# Altium schematic sheet 3_SCH_Autolog.SchDoc: PROYECTO FINAL - AutoLog
size A4; Revision: V1R1; SheetNumber: 4; SheetTotal: 4
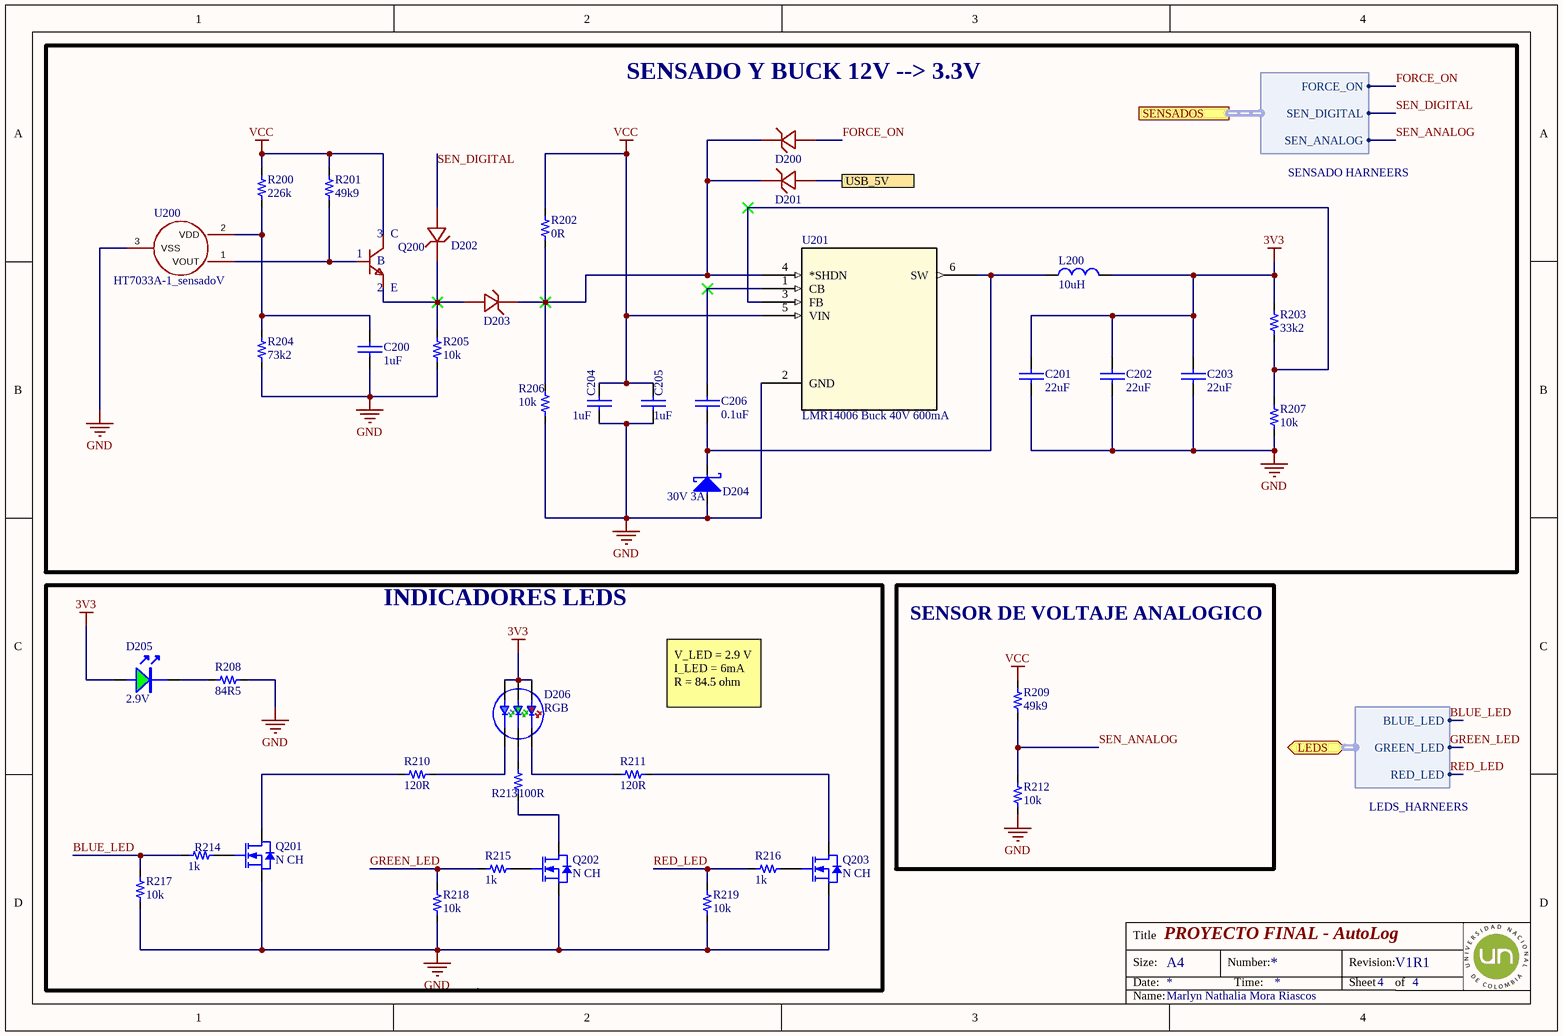
[diagram p0: 3_SCH_Autolog.SchDoc]

## Parts
C200  value 1uF  [0603_cap]  (hidden comment: 1uF 50V)
C201  value 22uF  [0603_cap]  (hidden comment: 22uF 10V)
C202  value 22uF  [0603_cap]  (hidden comment: 22uF 10V)
C203  value 22uF  [0603_cap]  (hidden comment: 22uF 10V)
C204  value 1uF  [0603_cap]  (hidden comment: 1uF 50V)
C205  value 1uF  [0603_cap]  (hidden comment: 1uF 50V)
C206  value 0.1uF  [0603_cap]  (hidden comment: 0.1uF 50V)
D200  1N4148WS  [SOD-323_1N4148]  (value not drawn)
D201  1N4148WS  [SOD-323_1N4148]  (value not drawn)
D202  1N4148WS  [SOD-323_1N4148]  (value not drawn)
D203  1N4148WS  [SOD-323_1N4148]  (value not drawn)
D204  30V 3A  [SMA]
D205  2.9V  [0805_LED]
D206  RGB  [RGB_NS_3.5X3.7]
L200  value 10uH  [Ind_5.8*5.2_NS]  (hidden comment: 10uH 1.42A)
Q200  SS8050  [SOT-23-3_TRANS NPN]  (value not drawn)
Q201  N CH  [SOT_23_3]
Q202  N CH  [SOT_23_3]
Q203  N CH  [SOT_23_3]
R200  value 226k  [0603_res]  (hidden comment: 226k 1/10W)
R201  value 49k9  [0603_res]  (hidden comment: 49k9 1/10W)
R202  value 0R  [0603_res]  (hidden comment: 0R 1/10W)
R203  value 33k2  [0603_res]  (hidden comment: 33k2 1/10W)
R204  value 73k2  [0603_res]  (hidden comment: 73k2 1/10W)
R205  value 10k  [0603_res]  (hidden comment: 10k 1/10W)
R206  value 10k  [0603_res]  (hidden comment: 10k 1/10W)
R207  value 10k  [0603_res]  (hidden comment: 10k 1/10W)
R208  value 84R5  [0603_res]  (hidden comment: 84R5 1/10W)
R209  value 49k9  [0603_res]  (hidden comment: 49k9 1/10W)
R210  value 120R  [0603_res]  (hidden comment: 120R 1/10W)
R211  value 120R  [0603_res]  (hidden comment: 120R 1/10W)
R212  value 10k  [0603_res]  (hidden comment: 10k 1/10W)
R213  value 100R  [0603_res]  (hidden comment: 100R 1/10W)
R214  value 1k  [0603_res]  (hidden comment: 1k 1/10W)
R215  value 1k  [0603_res]  (hidden comment: 1k 1/10W)
R216  value 1k  [0603_res]  (hidden comment: 1k 1/10W)
R217  value 10k  [0603_res]  (hidden comment: 10k 1/10W)
R218  value 10k  [0603_res]  (hidden comment: 10k 1/10W)
R219  value 10k  [0603_res]  (hidden comment: 10k 1/10W)
U200  HT7033A-1_sensadoV  [SOT-89-3_L4.5-W2.5-P1.50-LS4.2-BR]
U201  LMR14006 Buck 40V 600mA  [DDC6_TEX-M]

## Blocks framed on the sheet
SENSADO Y BUCK 12V --> 3.3V: C200-C206 D200-D204 L200 Q200 R200-R207 U200 U201
INDICADORES LEDS: D205 D206 Q201-Q203 R208 R210 R211 R213-R219
SENSOR DE VOLTAJE ANALOGICO: R209 R212

## Ports
LEDS (bidir, harness LEDS_HARNEERS, see Maiin[2C], 1_SCH_Autolog[2C]), SENSADOS (harness SENSADO HARNEERS, see Maiin[2C], 1_SCH_Autolog[2C]), USB_5V (see Maiin[3C], 2_SCH_Autolog[4B])

## Harnesses
LEDS_HARNEERS: RED_LED, GREEN_LED, BLUE_LED
SENSADO HARNEERS: FORCE_ON, SEN_DIGITAL, SEN_ANALOG

## Nets
3V3: C201.1 C202.1 C203.1 D205.1(A) D206.4 D206.5 D206.6 L200.2 R203.2
GND: C200.2 C201.2 C202.2 C203.2 C204.2 C205.2 D204.2 Q201.2(S) Q202.2(S) Q203.2(S) R204.1 R205.1 R206.1 R207.1 R208.2 R212.1 R217.2 R218.1 R219.1 U200.3(VSS) U201.2(GND)
VCC: C204.1 C205.1 Q200.3(C) R200.2 R201.1 R202.2 R209.2 U201.5(VIN)
BLUE_LED: R214.1 R217.1 ; port LEDS.BLUE_LED
FORCE_ON: D200.2 ; port SENSADOS.FORCE_ON
GREEN_LED: R215.1 R218.2 ; port LEDS.GREEN_LED
RED_LED: R216.1 R219.2 ; port LEDS.RED_LED
SEN_ANALOG: R209.1 R212.2 ; port SENSADOS.SEN_ANALOG
SEN_DIGITAL: D202.2 ; port SENSADOS.SEN_DIGITAL
USB_5V: D201.2 ; port USB_5V
NetC200_1: C200.1 R200.1 R204.2 U200.2(VDD)
NetC206_1: C206.1 U201.1(CB)
NetC206_2: C206.2 D204.1 L200.1 U201.6(SW)
NetD200_1: D200.1 D201.1 D203.1 R202.1 R206.2 U201.4(*SHDN)
NetD202_1: D202.1 D203.2 Q200.2(E) R205.2
NetD205_2: D205.2 R208.1
NetD206_1: D206.1 R210.1
NetD206_2: D206.2 R213.1
NetD206_3: D206.3 R211.1
NetQ200_1: Q200.1(B) R201.2 U200.1(VOUT)
NetQ201_1: Q201.1(G) R214.2
NetQ201_3: Q201.3(D) R210.2
NetQ202_1: Q202.1(G) R215.2
NetQ202_3: Q202.3(D) R213.2
NetQ203_1: Q203.1(G) R216.2
NetQ203_3: Q203.3(D) R211.2
NetR203_1: R203.1 R207.2 U201.3(FB)

## Notes on the sheet
- V_LED = 2.9 V
  I_LED = 6mA
  R = 84.5 ohm
- Title
- Size:
- Date:
- A4
- Number:
- Time:
- Revision:
- Sheet
- of
- Name:
- Marlyn Nathalia Mora Riascos

## Library data of the parts
C200 C204 C205 = Cap_1uF_0603_50V: 50V 1uF X5R ±10% 0603 Multilayer Ceramic Capacitors MLCC - SMD/SMT ROHS; Manufacturer: Samsung Electro-Mechanics; Manufacturer Part Number: CL10A105KB8NNNC; Supplier 1: LCSC; Supplier Part Number 1: C15849; ComponentLink1Description: LCSC; ComponentLink1URL: https://www.lcsc.com/product-detail/Multilayer-Ceramic-Capacitors-MLCC-SMD-SMT_Samsung-Electro-Mechanics-CL10A105KB8NNNC_C15849.html
  C200: ComponentLink2Description: Datashhet; ComponentLink2URL: https://www.lcsc.com/datasheet/C15849.pdf
C201-C203 = Cap_22uF_0603_10V: 10V 22uF X5R ±20% 0603 Multilayer Ceramic Capacitors MLCC - SMD/SMT ROHS; Manufacturer: HRE; Manufacturer Part Number: CGA0603X5R226M100JT; Supplier 1: LCSC; Supplier Part Number 1: C6119863; ComponentLink1Description: LCSC; ComponentLink1URL: https://lcsc.com/product-detail/Multilayer-Ceramic-Capacitors-MLCC-SMD-SMT_HRE-CGA0603X5R226M100JT_C6119863.html; ComponentLink2Description: Datasheet; ComponentLink2URL: https://www.lcsc.com/datasheet/C6119863.pdf
C206 = Cap_0.1uF_0603_50V: 50V 100nF Y5V -20%~+80% 0603 Multilayer Ceramic Capacitors MLCC - SMD/SMT ROHS; Manufacturer: Walsin Tech Corp; Manufacturer Part Number: 0603F104Z500CT; Supplier 1: LCSC; Supplier Part Number 1: C83060; ComponentLink1Description: LCSC; ComponentLink1URL: https://www.lcsc.com/product-detail/Multilayer-Ceramic-Capacitors-MLCC-SMD-SMT_Walsin-Tech-Corp-0603F104Z500CT_C83060.html; ComponentLink2Description: Datasheet; ComponentLink2URL: https://www.lcsc.com/datasheet/C83060.pdf
D200-D203 = 1N4148WS_DIODE: DIODE GP 100V 150mA SOD-323; Manufacturer: JSCJ; Manufacturer Part Number: 1N4148WS; Supplier 1: LCSC; Supplier Part Number 1: C2128; ComponentLink1Description: JSCJ; ComponentLink1URL: https://www.lcsc.com/product-detail/Switching-Diode_JCET-1N4148WS_C2128.html; ComponentLink2Description: Datasheet; ComponentLink2URL: https://www.lcsc.com/datasheet/C2128.pdf
D204 = D_Schottky_40V_3A_SMA: 40V Independent 3A 550mV@3A SMA Schottky Diodes ROHS; Manufacturer: TDSEMIC; Manufacturer Part Number: SS34-TD; Supplier 1: LCSC; Supplier Part Number 1: C46550832; ComponentLink1Description: LCSC; ComponentLink1URL: https://lcsc.com/product-detail/Schottky-Diodes_TDSEMIC-SS34-TD_C46550832.html; ComponentLink2Description: Datasheet; ComponentLink2URL: https://www.lcsc.com/datasheet/C46550832.pdf; ComponentLink3Description: New link
D205 = LED_0805_Green: LED GREEN CLEAR 0805 SMD; Manufacturer: XINGLIGHT; Manufacturer Part Number: XL-2012UGC; Supplier 1: LCSC; Supplier Part Number 1: C965815; ComponentLink1Description: LCSC; ComponentLink1URL: https://www.lcsc.com/product-detail/Light-Emitting-Diodes-LED_XINGLIGHT-XL-2012UGC_C965815.html
D206 = LED_RGB_3535_SMD: -30℃~+85℃ RGB 110° 3535(mm) Light Emitting Diodes (LED) ROHS; Manufacturer: Foshan NationStar Optoelectronics; Manufacturer Part Number: RS-3535MWAM; Supplier 1: LCSC; Supplier Part Number 1: C842778; ComponentLink1Description: LCSC; ComponentLink1URL: https://www.lcsc.com/product-detail/Light-Emitting-Diodes-LED_Foshan-NationStar-Optoelectronics-RS-3535MWAM_C842778.html
L200 = Inductor_10uH_1.42A_5.8*5.2mm: 1.42A 10uH ±10% 87.9mΩ SMD,5.8x5.2mm Inductors (SMD) ROHS; Manufacturer: SHOU HAN; Manufacturer Part Number: CY54-10UH; Supplier 1: LCSC; Supplier Part Number 1: C2929431; ComponentLink1Description: LCSC; ComponentLink1URL: https://lcsc.com/product-detail/Inductors-SMD_SHOU-HAN-CY54-4-7UH_C2929429.html; ComponentLink2Description: Datasheet; ComponentLink2URL: https://www.lcsc.com/datasheet/C2929429.pdf
Q200 = TRANS_NPN_SS8050_SOT23: SS8050 Transistor BJT NPN 40V 1.5A; Manufacturer: JSCJ; Manufacturer Part Number: SS8050(RANGE:200-350); Supplier 1: LCSC; Supplier Part Number 1: C2150; ComponentLink1Description: LCSC; ComponentLink1URL: https://www.lcsc.com/product-detail/Bipolar-Transistors-BJT_JCET-SS8050_C2150.html; ComponentLink2Description: Datasheet; ComponentLink2URL: https://www.lcsc.com/datasheet/C2150.pdf
Q201-Q203 = Q_NFET_20V_3.2A_SOT23: MOSFET N-CH 20V SOT23; Manufacturer: Doeshare; Manufacturer Part Number: DN2302S; Supplier 1: LCSC; Supplier Part Number 1: C2931750; ComponentLink1Description: LCSC; ComponentLink1URL: https://www.lcsc.com/product-detail/MOSFETs_Doeshare-DN2302S_C2931750.html
R200 = Res_226k_0603_1/10W: 100mW Thick Film Resistors 75V ±100ppm/℃ ±1% 226kΩ 0603 Chip Resistor - Surface Mount ROHS; Manufacturer: YAGEO; Manufacturer Part Number: RC0603FR-07226KL; ComponentLink1URL: https://lcsc.com/product-detail/Chip-Resistor-Surface-Mount_YAGEO-RC0603FR-07226KL_C165744.html; Supplier 1: LCSC; Supplier Part Number 1: C165744; ComponentLink1Description: LCSC
R201 R209 = Res_49k9_0603_1/10W: 100mW Thick Film Resistor 75V ±100ppm/℃ ±1% 49.9kΩ 0603 Chip Resistor - Surface Mount ROHS; Manufacturer: YAGEO; Manufacturer Part Number: RC0603FR-0749K9L; ComponentLink1URL: https://lcsc.com/product-detail/Chip-Resistor-Surface-Mount_YAGEO-RC0603FR-0749K9L_C114624.html; Supplier 1: LCSC; Supplier Part Number 1: C114624; ComponentLink1Description: LCSC
R202 = Res_0R_0603_1/10W: RES SMD 0R OHM 5% 1/10W 0603; Manufacturer: FOJAN; Manufacturer Part Number: FRC0603P000 TS; ComponentLink1URL: https://www.lcsc.com/product-detail/Chip-Resistor-Surface-Mount_FOJAN-FRC0603P000-TS_C2907080.html; Supplier 1: LCSC; Supplier Part Number 1: C2907080; ComponentLink1Description: LCSC; ComponentLink2Description: Datasheet; ComponentLink2URL: https://www.lcsc.com/datasheet/C2907080.pdf
R203 = Res_33k2_0603_1/10W: 100mW Thick Film Resistor 75V ±100ppm/℃ ±1% 33.2kΩ 0603 Chip Resistor - Surface Mount ROHS; Manufacturer: YAGEO; Manufacturer Part Number: RC0603FR-0733K2L; ComponentLink1URL: https://lcsc.com/product-detail/Chip-Resistor-Surface-Mount_YAGEO-RC0603FR-0733K2L_C185338.html; Supplier 1: LCSC; Supplier Part Number 1: C185338; ComponentLink1Description: LCSC; ComponentLink2Description: Datasheet; ComponentLink2URL: https://www.lcsc.com/datasheet/C185338.pdf
R204 = Res_73k2_0603_1/10W: 100mW Thick Film Resistor 75V ±100ppm/℃ ±1% 73.2kΩ 0603 Chip Resistor - Surface Mount ROHS; Manufacturer: YAGEO; Manufacturer Part Number: RC0603FR-0773K2L; ComponentLink1URL: https://lcsc.com/product-detail/Chip-Resistor-Surface-Mount_YAGEO-RC0603FR-0773K2L_C163420.html; Supplier 1: LCSC; Supplier Part Number 1: C163420; ComponentLink1Description: LCSC
R205-R207 R212 R217-R219 = Res_10k_0603_1/10W: RES SMD 10k OHM 5% 1/10W 0603; Manufacturer: FOJAN; Manufacturer Part Number: FRC0603J103TS; ComponentLink1URL: https://www.lcsc.com/product-detail/Chip-Resistor-Surface-Mount_FOJAN-FRC0603J103TS_C2930027.html; Supplier 1: LCSC; Supplier Part Number 1: C2930027; ComponentLink1Description: LCSC; ComponentLink2Description: Datasheet; ComponentLink2URL: https://www.lcsc.com/datasheet/C2930027.pdf
R208 = Res_84R5_0603_1/10W: 100mW Thick Film Resistor 50V ±100ppm/℃ ±1% 84.5Ω 0603 Chip Resistor - Surface Mount ROHS; Manufacturer: LIZ Elec; Manufacturer Part Number: CR0603FA84R5G; ComponentLink1URL: https://lcsc.com/product-detail/Chip-Resistor-Surface-Mount_LIZ-Elec-CR0603FA84R5G_C101216.html; Supplier 1: LCSC; Supplier Part Number 1: C101216; ComponentLink1Description: LCSC
R210 R211 = Res_120R_0603_1/10W: 100mW Thick Film Resistor 75V ±100ppm/℃ ±1% 120Ω 0603 Chip Resistor - Surface Mount ROHS; Manufacturer: FOJAN; Manufacturer Part Number: FRC0603F1200TS; ComponentLink1URL: https://lcsc.com/product-detail/Chip-Resistor-Surface-Mount_FOJAN-FRC0603F1200TS_C2906988.html; Supplier 1: LCSC; Supplier Part Number 1: C2906988; ComponentLink1Description: LCSC; ComponentLink2Description: Datasheet; ComponentLink2URL: https://www.lcsc.com/datasheet/C2906988.pdf
R213 = Res_100R_0603_1/10W: RES SMD 100R OHM 5% 1/10W 0603; Manufacturer: FOJAN; Manufacturer Part Number: FRC0603J101 TS; ComponentLink1URL: https://www.lcsc.com/product-detail/Chip-Resistor-Surface-Mount_FOJAN-FRC0603J101-TS_C2907089.html; Supplier 1: LCSC; Supplier Part Number 1: C2907089; ComponentLink1Description: LCSC
R214-R216 = Res_1k_0603_1/10W: RES SMD 1k OHM 5% 1/10W 0603; Manufacturer: FOJAN; Manufacturer Part Number: FRC0603J102 TS; ComponentLink1URL: https://www.lcsc.com/product-detail/Chip-Resistor-Surface-Mount_FOJAN-FRC0603J102-TS_C2907113.html; Supplier 1: LCSC; Supplier Part Number 1: C2907113; ComponentLink1Description: LCSC; ComponentLink2Description: Datashhet; ComponentLink2URL: https://www.lcsc.com/datasheet/C2907152.pdf
U200 = HOLTEK HT7033A-1_sensadoV: Detector de tensión con umbral de 3.3V; Manufacturer: HOLTEK; Suplier  Part Number: C73715; Manufacturer product number: HT7033A-1; ComponentLink1Description: DataSheep; ComponentLink1URL: https://datasheet4u.com/download/529551/HT7033A-1.html; Supplier 1: LCSC; ComponentLink2Description: LCSC; ComponentLink2URL: https://www.lcsc.com/product-detail/C73715.html?s_z=n_q_p_HT7033A-1%2520SOT-23&spm=wm.ssy.bg.0.stp&lcsc_vid=RVlWUQFUEwdfUgVfRQdXU1JeFFlaBFcDFVVaX1BTQFUxVlNfRVhaXldRT1NYUTsOAxUeFF5JWBYZEEoKFBINSQcJGk4eFQsCAgIaSgADAwAHC0swGA0aBgMDWiULEwEFAw4cFDsoFg8EDgoBWiwHBBYJWi4AAkkjGwQNSikjRVleUCVVRCxdIDslRVJYUFFTWQkaCgg%3D
U201 = LMR14006XDDCR: IC REG BUCK ADJ 600MA SOT23; Manufacturer: Texas Instruments; Suplier  Part Number: 296-44318-2-ND; Manufacturer product number: LMR14006XDDCR; ComponentLink1Description: DataSheep; ComponentLink1URL: https://www.ti.com/lit/ds/symlink/lmr14006.pdf?HQS=dis-dk-null-digikeymode-dsf-pf-null-wwe&ts=1794157197651; Supplier 1: Digikey; ComponentLink2Description: Digikey; ComponentLink2URL: https://www.digikey.com/en/products/detail/texas-instruments/LMR14006XDDCR/5176217?s=N4IgTCBcDaICoEkAEAZAsgJQIwBYAMeAbABoAipAwhiALoC%2BQA